# Altium schematic sheet 07_Clock.SchDoc
size A3; SheetNumber: 14; SheetTotal: 21
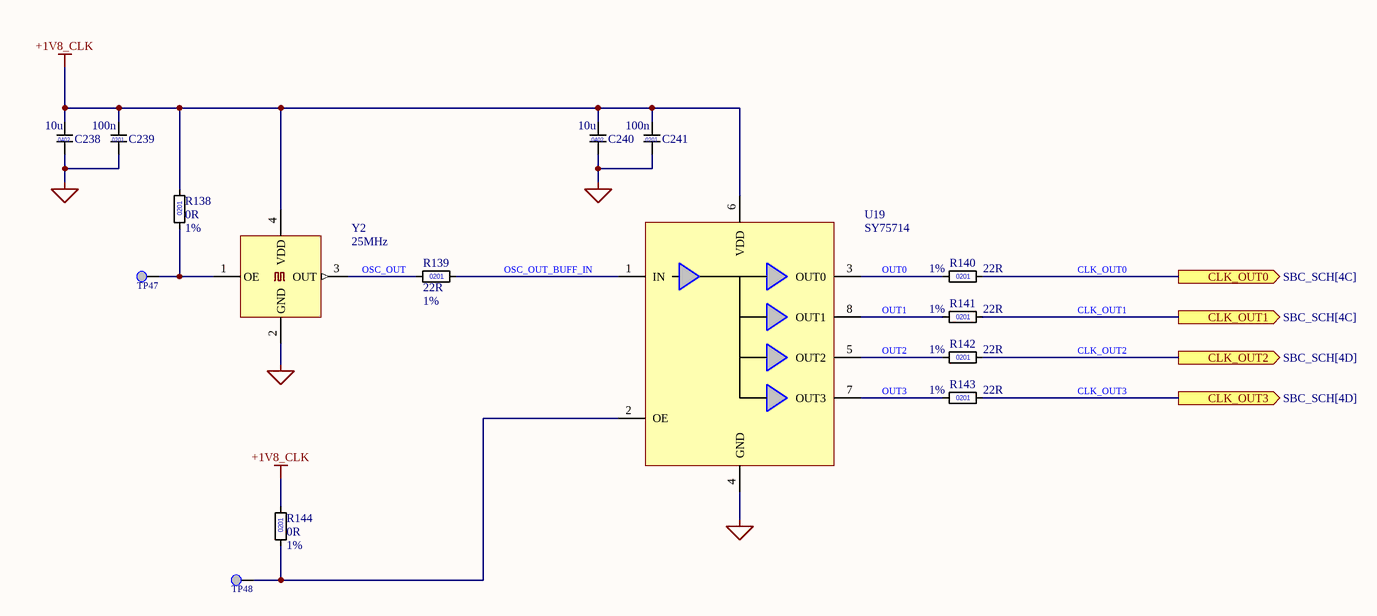
[diagram p0: 07_Clock.SchDoc]

## Parts
C238  value 10u  [C0402]  (hidden comment: 4u7)
C239  value 100n  [C0201]  (hidden comment: C_0201)
C240  value 10u  [C0402]  (hidden comment: 4u7)
C241  value 100n  [C0201]  (hidden comment: C_0201)
R138  value 0R  Tolerance: 1%  [R0201]  (hidden comment: 0201)
R139  value 22R  Tolerance: 1%  [R0201]  (hidden comment: 0201)
R140  value 22R  Tolerance: 1%  [R0201]  (hidden comment: 0201)
R141  value 22R  Tolerance: 1%  [R0201]  (hidden comment: 0201)
R142  value 22R  Tolerance: 1%  [R0201]  (hidden comment: 0201)
R143  value 22R  Tolerance: 1%  [R0201]  (hidden comment: 0201)
R144  value 0R  Tolerance: 1%  [R0201]  (hidden comment: 0201)
TP47  Testpoint 0.5mm  [TP_0.50mm]  (value not drawn)  (no BOM)
TP48  Testpoint 0.5mm  [TP_0.50mm]  (value not drawn)  (no BOM)
U19  SY75714  [TDFN-8-2x2mm_P0.5mm]
Y2  value 25MHz  [Oscillator_SMD_ECS_2520MV-xxx-xx-4Pin_2.5x2.0mm]  (hidden comment: ECS-2520MV)

## Ports
CLK_OUT0 (out, see SBC_SCH[4C]), CLK_OUT1 (out, see SBC_SCH[4C]), CLK_OUT2 (out, see SBC_SCH[4D]), CLK_OUT3 (out, see SBC_SCH[4D])

## Nets
+1V8_CLK: C238.1 C239.1 C240.1 C241.1 R138.R? R144.R? U19.6(VDD) Y2.4(VDD)
GND: C238.2 C239.2 C240.2 C241.2 U19.4(GND) Y2.2(GND)
CLK_OUT0: R140.R? ; port CLK_OUT0
CLK_OUT1: R141.R? ; port CLK_OUT1
CLK_OUT2: R142.R? ; port CLK_OUT2
CLK_OUT3: R143.R? ; port CLK_OUT3
OSC_OUT: R139.1 Y2.3(OUT)
OSC_OUT_BUFF_IN: R139.R? U19.1(IN)
OUT0: R140.1 U19.3(OUT0)
OUT1: R141.1 U19.8(OUT1)
OUT2: R142.1 U19.5(OUT2)
OUT3: R143.1 U19.7(OUT3)
NetR138_1: R138.1 TP47.TP Y2.1(OE)
NetR144_1: R144.1 TP48.TP U19.2(OE)

## Notes on the sheet
- (in symbol C_0201) 0201
- (in symbol C_0402) 0402

## Library data of the parts
C238 C240 = C_0402: MLCC 0402; Manufacturer_Name: *; Manufacturer_Part_Number: *
C239 C241 = C_0201: MLCC 0201; Manufacturer_Name: *; Manufacturer_Part_Number: *
R138-R144 = R_0201: Manufacturer_Name: *; Manufacturer_Part_Number: *
U19 = SY75714: Clock Clock Buffer IC 1:4 250 MHz 8-WFDFN Exposed Pad; Manufacturer_Name: *; Manufacturer_Part_Number: *; Value: SY75714
Y2 = ECS-2520MV: 25 MHz XO (Standard) HCMOS Oscillator 1.6V ~ 3.6V Enable/Disable 4-SMD, No Lead; Manufacturer_Part_Number: ECS-2520MV-250-CN-TR; Manufacturer_Name: ECS